# EAGLE design pid2_levitador (EAGLE 9.6.2)
Controladores PID analógicos con etapa de potencia (levitador magnético) - Brahiam Alberto Campiño Romero

## Sheet 1 of 2
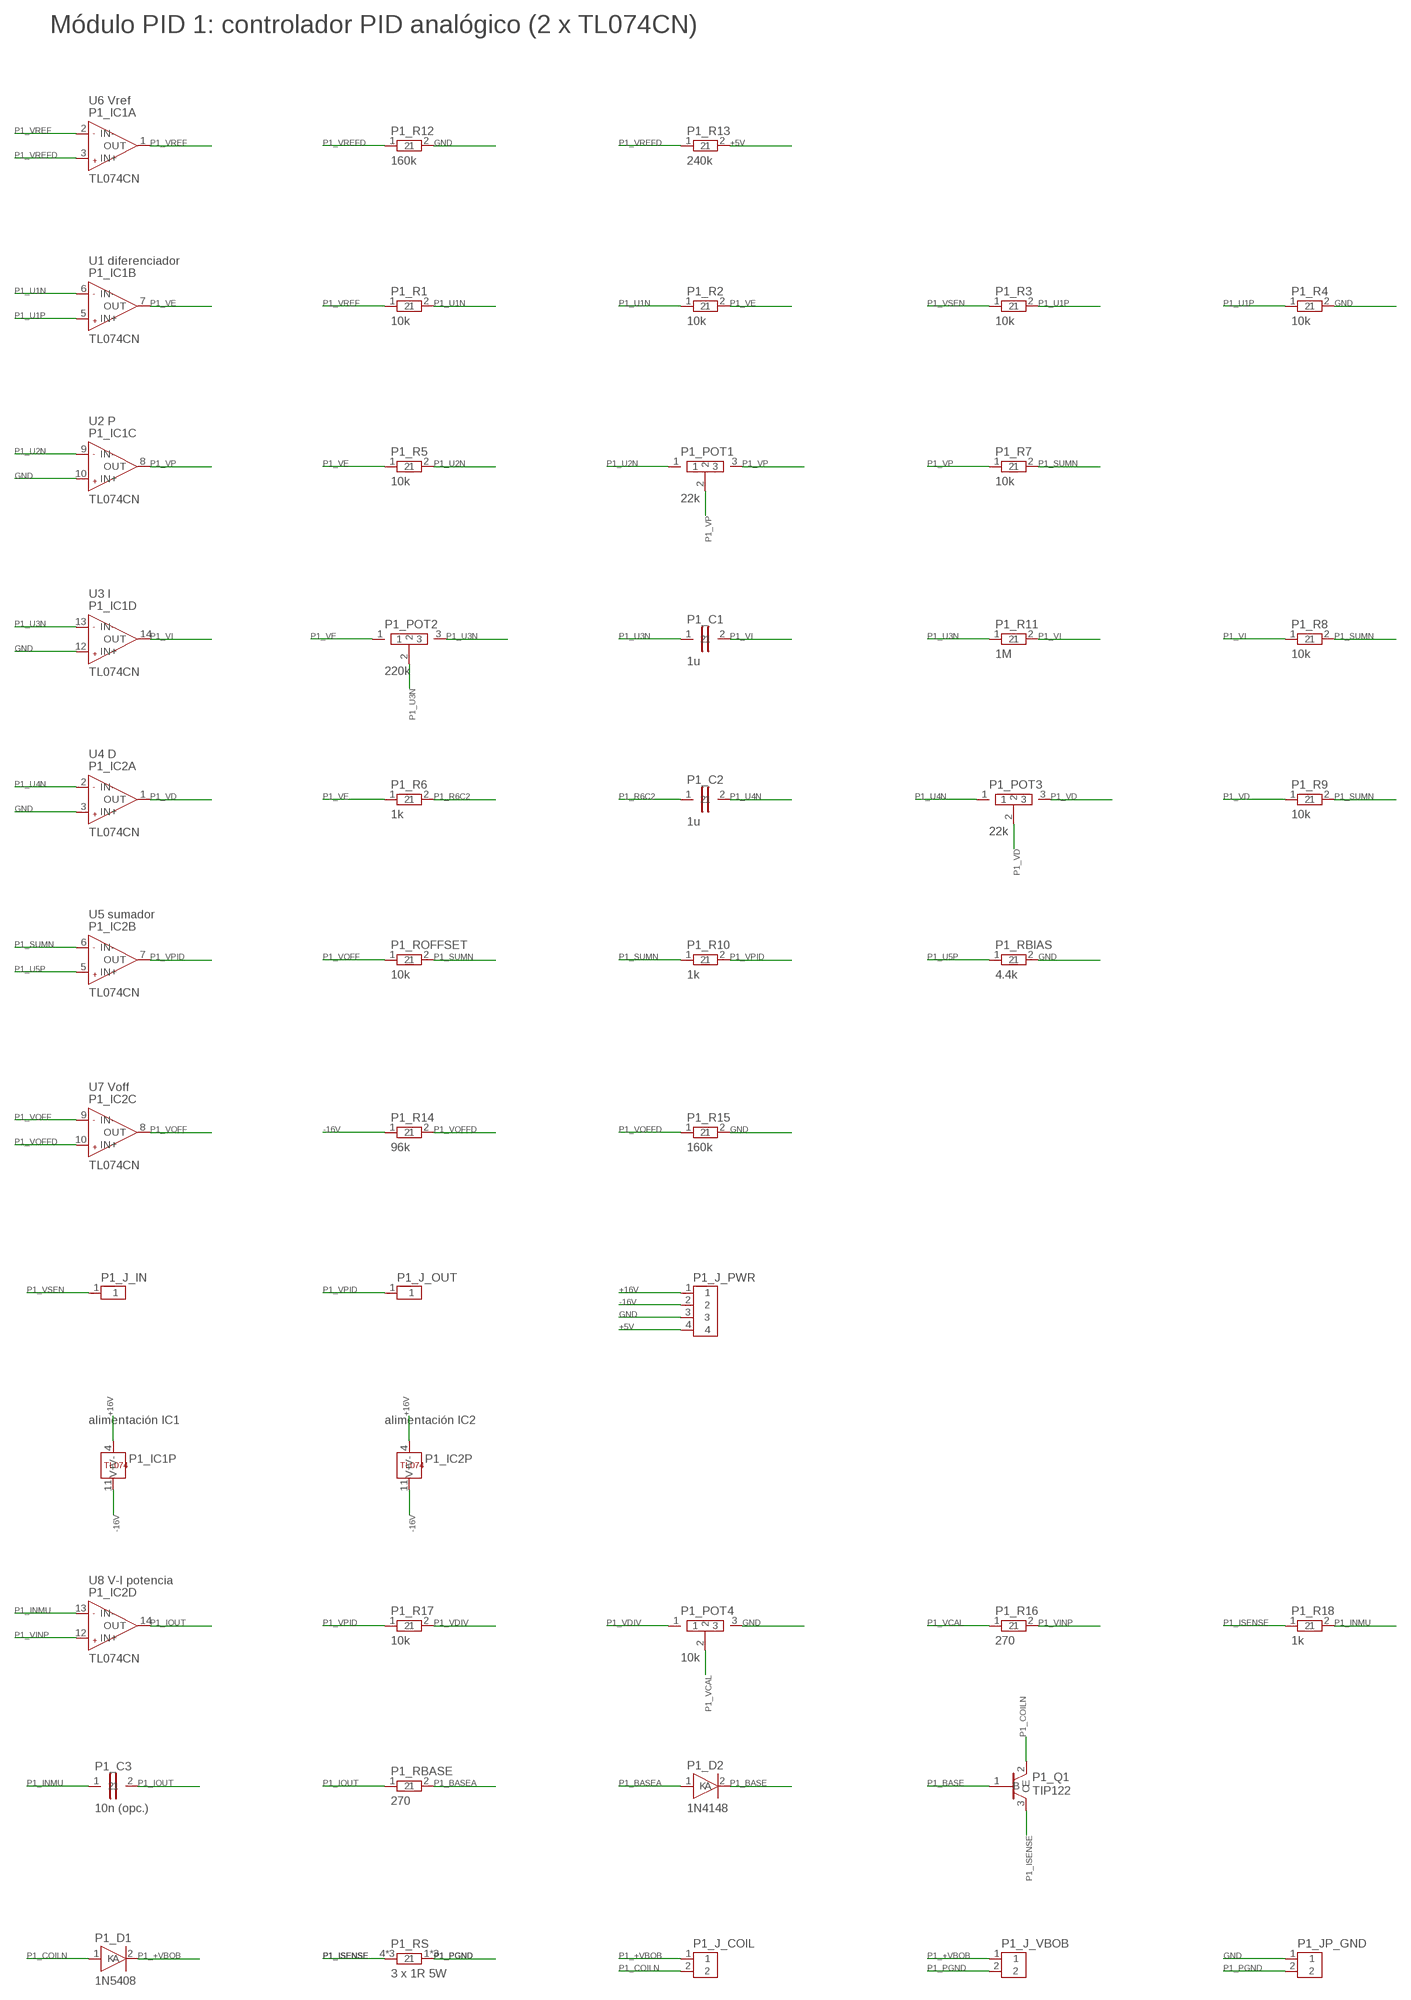
[diagram p0: schematic, sheet 1]

### Parts
P1_C1  1u  C  [CAP]
P1_C2  1u  C  [CAP]
P1_C3  10n (opc.)  C  [CAP]
P1_D1  1N5408  D1N5408  [DIODE]
P1_D2  1N4148  D1N4148  [DIODE_S]
P1_IC1  TL074CN  TL074  [DIL14]
P1_IC2  TL074CN  TL074  [DIL14]
P1_J_COIL  BOBINA  TERM2  [TERM2]
P1_J_IN  VSENSOR  HDR1  [HDR1]
P1_J_OUT  VPID  HDR1  [HDR1]
P1_J_PWR  PWR  HDR4  [HDR4]
P1_J_VBOB  VBOB  TERM2  [TERM2]
P1_JP_GND  GND-PGND  HDR2  [HDR2]
P1_POT1  22k  POT  [POT]
P1_POT2  220k  POT  [POT]
P1_POT3  22k  POT  [POT]
P1_POT4  10k  POT  [POT]
P1_Q1  TIP122  [TO220]
P1_R1  10k  R  [RES]
P1_R2  10k  R  [RES]
P1_R3  10k  R  [RES]
P1_R4  10k  R  [RES]
P1_R5  10k  R  [RES]
P1_R6  1k  R  [RES]
P1_R7  10k  R  [RES]
P1_R8  10k  R  [RES]
P1_R9  10k  R  [RES]
P1_R10  1k  R  [RES]
P1_R11  1M  R  [RES]
P1_R12  160k  R  [RES]
P1_R13  240k  R  [RES]
P1_R14  96k  R  [RES]
P1_R15  160k  R  [RES]
P1_R16  270  R  [RES]
P1_R17  10k  R  [RES]
P1_R18  1k  R  [RES]
P1_RBASE  270  R  [RES]
P1_RBIAS  4.4k  R  [RES]
P1_ROFFSET  10k  R  [RES]
P1_RS  3 x 1R 5W  RSB  [RSBANK]

### Nets
+5V: P1_J_PWR.4 P1_R13.2 ; also sheet 2
+16V: P1_IC1.4(P:V+) P1_IC2.4(P:V+) P1_J_PWR.1 ; also sheet 2
-16V: P1_IC1.11(P:V-) P1_IC2.11(P:V-) P1_J_PWR.2 P1_R14.1 ; also sheet 2
GND: P1_IC1.10(C:IN+) P1_IC1.12(D:IN+) P1_IC2.3(A:IN+) P1_J_PWR.3 P1_JP_GND.1 P1_POT4.3 P1_R4.2 P1_R12.2 P1_R15.2 P1_RBIAS.2 ; also sheet 2
P1_+VBOB: P1_D1.2(K) P1_J_COIL.1 P1_J_VBOB.1
P1_BASE: P1_D2.2(K) P1_Q1.1(B)
P1_BASEA: P1_D2.1(A) P1_RBASE.2
P1_COILN: P1_D1.1(A) P1_J_COIL.2 P1_Q1.2(C)
P1_INMU: P1_C3.1 P1_IC2.13(D:IN-) P1_R18.2
P1_IOUT: P1_C3.2 P1_IC2.14(D:OUT) P1_RBASE.1
P1_ISENSE: P1_Q1.3(E) P1_R18.1 P1_RS.4 P1_RS.5 P1_RS.6
P1_PGND: P1_J_VBOB.2 P1_JP_GND.2 P1_RS.1 P1_RS.2 P1_RS.3
P1_R6C2: P1_C2.1 P1_R6.2
P1_SUMN: P1_IC2.6(B:IN-) P1_R7.2 P1_R8.2 P1_R9.2 P1_R10.1 P1_ROFFSET.2
P1_U1N: P1_IC1.6(B:IN-) P1_R1.2 P1_R2.1
P1_U1P: P1_IC1.5(B:IN+) P1_R3.2 P1_R4.1
P1_U2N: P1_IC1.9(C:IN-) P1_POT1.1 P1_R5.2
P1_U3N: P1_C1.1 P1_IC1.13(D:IN-) P1_POT2.2 P1_POT2.3 P1_R11.1
P1_U4N: P1_C2.2 P1_IC2.2(A:IN-) P1_POT3.1
P1_U5P: P1_IC2.5(B:IN+) P1_RBIAS.1
P1_VCAL: P1_POT4.2 P1_R16.1
P1_VD: P1_IC2.1(A:OUT) P1_POT3.2 P1_POT3.3 P1_R9.1
P1_VDIV: P1_POT4.1 P1_R17.2
P1_VE: P1_IC1.7(B:OUT) P1_POT2.1 P1_R2.2 P1_R5.1 P1_R6.1
P1_VI: P1_C1.2 P1_IC1.14(D:OUT) P1_R8.1 P1_R11.2
P1_VINP: P1_IC2.12(D:IN+) P1_R16.2
P1_VOFF: P1_IC2.8(C:OUT) P1_IC2.9(C:IN-) P1_ROFFSET.1
P1_VOFFD: P1_IC2.10(C:IN+) P1_R14.2 P1_R15.1
P1_VP: P1_IC1.8(C:OUT) P1_POT1.2 P1_POT1.3 P1_R7.1
P1_VPID: P1_IC2.7(B:OUT) P1_J_OUT.1 P1_R10.2 P1_R17.1
P1_VREF: P1_IC1.1(A:OUT) P1_IC1.2(A:IN-) P1_R1.1
P1_VREFD: P1_IC1.3(A:IN+) P1_R12.1 P1_R13.1
P1_VSEN: P1_J_IN.1 P1_R3.1

### Notes on the sheet
- Módulo PID 1: controlador PID analógico (2 x TL074CN)
- U6 Vref
- U1 diferenciador
- U2 P
- U3 I
- U4 D
- U5 sumador
- U7 Voff
- alimentación IC1 | alimentación IC2
- U8 V-I potencia

## Sheet 2 of 2
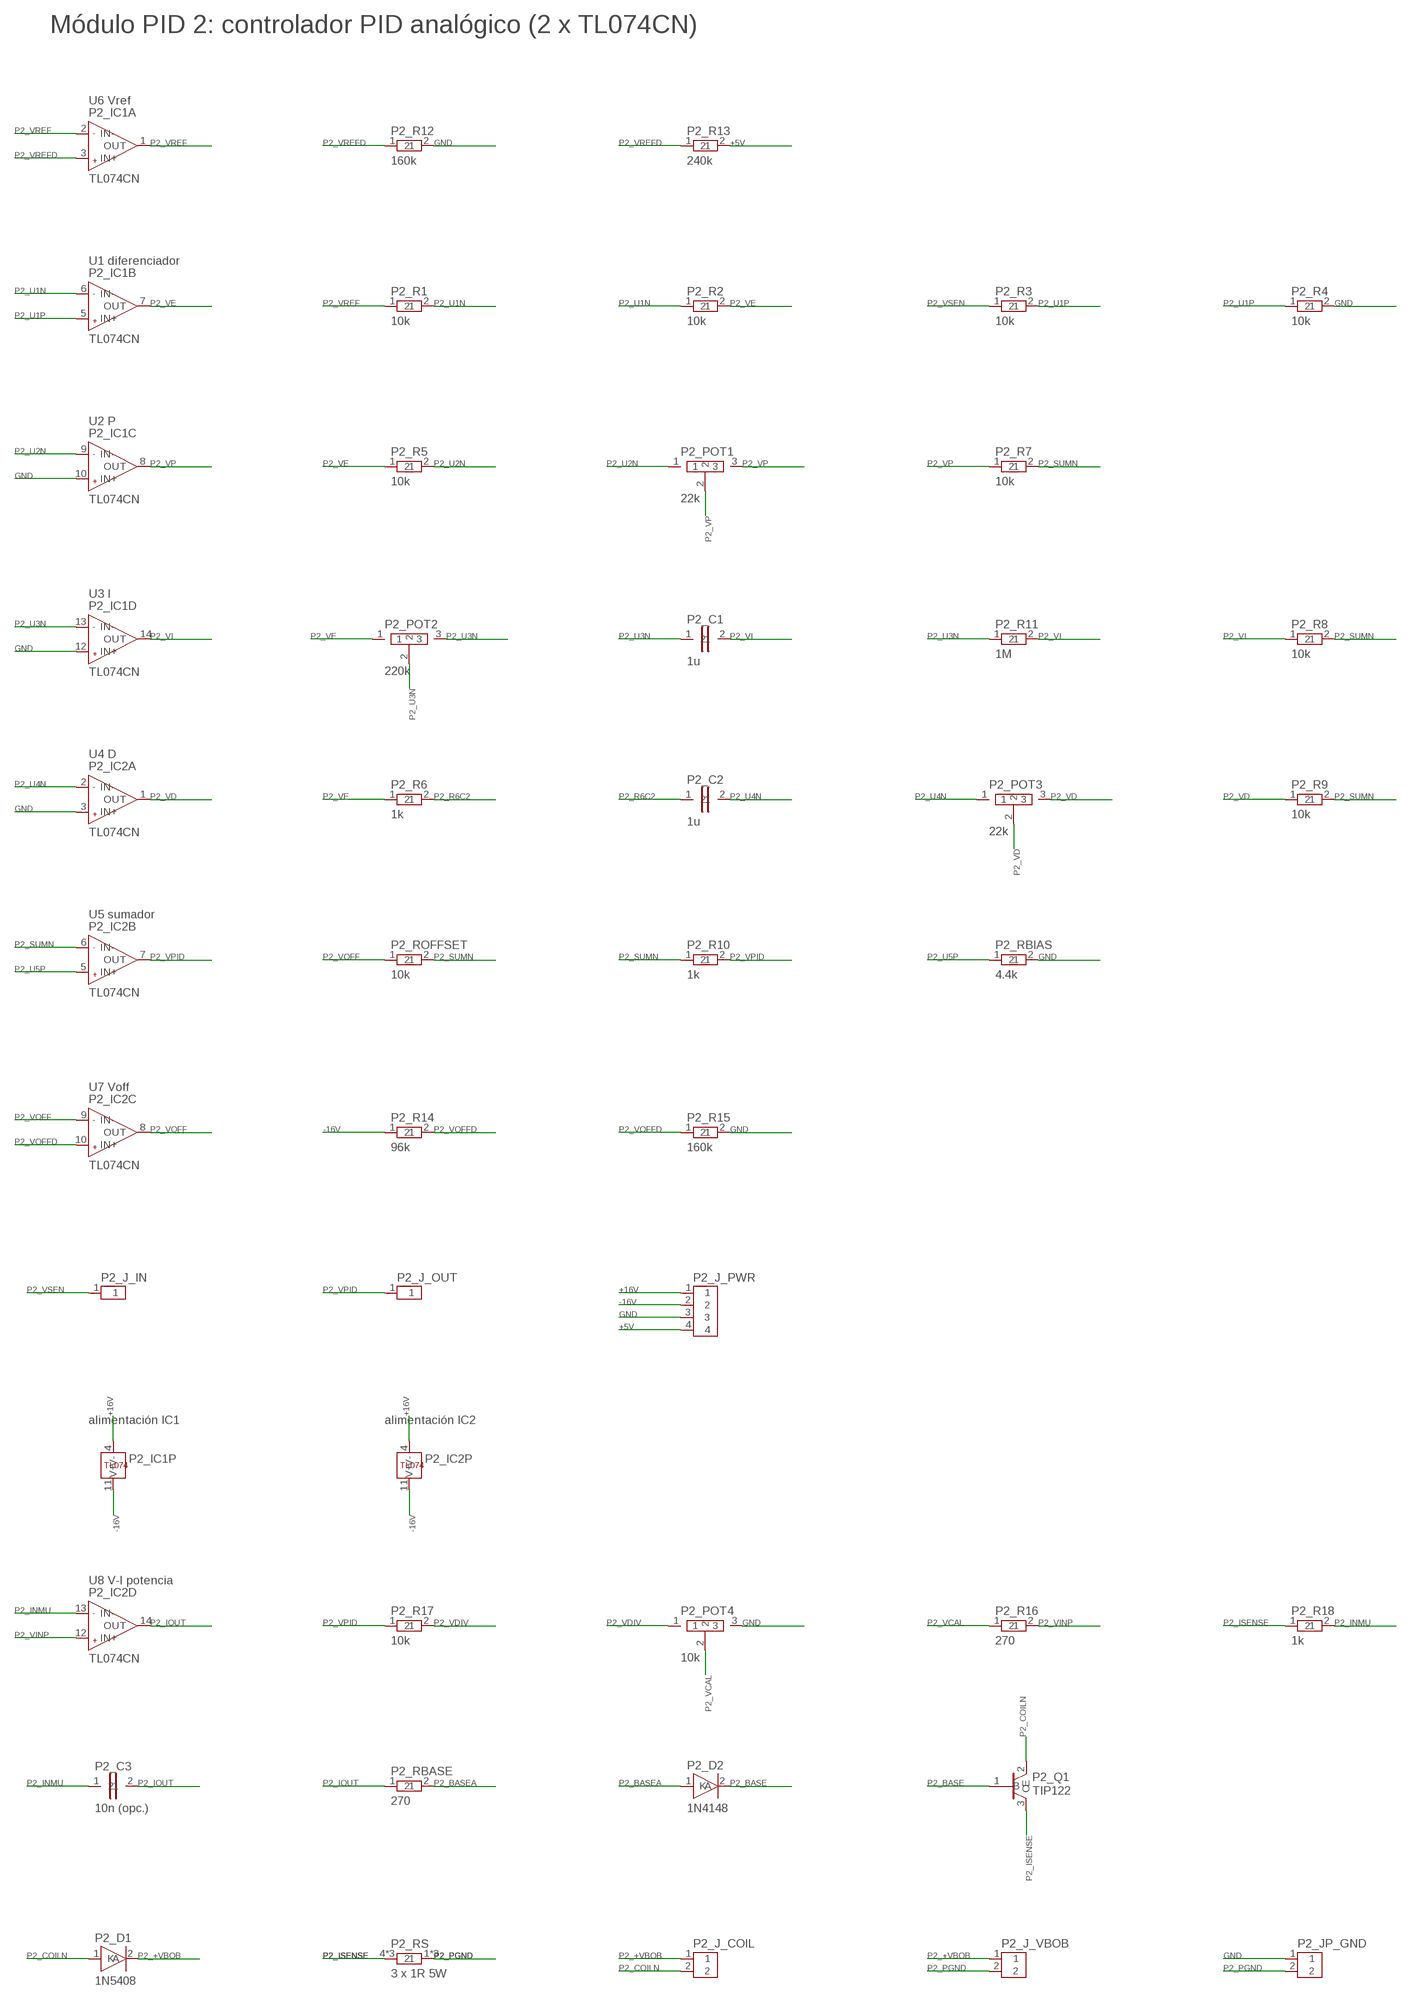
[diagram p1: schematic, sheet 2]

### Parts
P2_C1  1u  C  [CAP]
P2_C2  1u  C  [CAP]
P2_C3  10n (opc.)  C  [CAP]
P2_D1  1N5408  D1N5408  [DIODE]
P2_D2  1N4148  D1N4148  [DIODE_S]
P2_IC1  TL074CN  TL074  [DIL14]
P2_IC2  TL074CN  TL074  [DIL14]
P2_J_COIL  BOBINA  TERM2  [TERM2]
P2_J_IN  VSENSOR  HDR1  [HDR1]
P2_J_OUT  VPID  HDR1  [HDR1]
P2_J_PWR  PWR  HDR4  [HDR4]
P2_J_VBOB  VBOB  TERM2  [TERM2]
P2_JP_GND  GND-PGND  HDR2  [HDR2]
P2_POT1  22k  POT  [POT]
P2_POT2  220k  POT  [POT]
P2_POT3  22k  POT  [POT]
P2_POT4  10k  POT  [POT]
P2_Q1  TIP122  [TO220]
P2_R1  10k  R  [RES]
P2_R2  10k  R  [RES]
P2_R3  10k  R  [RES]
P2_R4  10k  R  [RES]
P2_R5  10k  R  [RES]
P2_R6  1k  R  [RES]
P2_R7  10k  R  [RES]
P2_R8  10k  R  [RES]
P2_R9  10k  R  [RES]
P2_R10  1k  R  [RES]
P2_R11  1M  R  [RES]
P2_R12  160k  R  [RES]
P2_R13  240k  R  [RES]
P2_R14  96k  R  [RES]
P2_R15  160k  R  [RES]
P2_R16  270  R  [RES]
P2_R17  10k  R  [RES]
P2_R18  1k  R  [RES]
P2_RBASE  270  R  [RES]
P2_RBIAS  4.4k  R  [RES]
P2_ROFFSET  10k  R  [RES]
P2_RS  3 x 1R 5W  RSB  [RSBANK]

### Nets
+5V: P2_J_PWR.4 P2_R13.2 ; also sheet 1
+16V: P2_IC1.4(P:V+) P2_IC2.4(P:V+) P2_J_PWR.1 ; also sheet 1
-16V: P2_IC1.11(P:V-) P2_IC2.11(P:V-) P2_J_PWR.2 P2_R14.1 ; also sheet 1
GND: P2_IC1.10(C:IN+) P2_IC1.12(D:IN+) P2_IC2.3(A:IN+) P2_J_PWR.3 P2_JP_GND.1 P2_POT4.3 P2_R4.2 P2_R12.2 P2_R15.2 P2_RBIAS.2 ; also sheet 1
P2_+VBOB: P2_D1.2(K) P2_J_COIL.1 P2_J_VBOB.1
P2_BASE: P2_D2.2(K) P2_Q1.1(B)
P2_BASEA: P2_D2.1(A) P2_RBASE.2
P2_COILN: P2_D1.1(A) P2_J_COIL.2 P2_Q1.2(C)
P2_INMU: P2_C3.1 P2_IC2.13(D:IN-) P2_R18.2
P2_IOUT: P2_C3.2 P2_IC2.14(D:OUT) P2_RBASE.1
P2_ISENSE: P2_Q1.3(E) P2_R18.1 P2_RS.4 P2_RS.5 P2_RS.6
P2_PGND: P2_J_VBOB.2 P2_JP_GND.2 P2_RS.1 P2_RS.2 P2_RS.3
P2_R6C2: P2_C2.1 P2_R6.2
P2_SUMN: P2_IC2.6(B:IN-) P2_R7.2 P2_R8.2 P2_R9.2 P2_R10.1 P2_ROFFSET.2
P2_U1N: P2_IC1.6(B:IN-) P2_R1.2 P2_R2.1
P2_U1P: P2_IC1.5(B:IN+) P2_R3.2 P2_R4.1
P2_U2N: P2_IC1.9(C:IN-) P2_POT1.1 P2_R5.2
P2_U3N: P2_C1.1 P2_IC1.13(D:IN-) P2_POT2.2 P2_POT2.3 P2_R11.1
P2_U4N: P2_C2.2 P2_IC2.2(A:IN-) P2_POT3.1
P2_U5P: P2_IC2.5(B:IN+) P2_RBIAS.1
P2_VCAL: P2_POT4.2 P2_R16.1
P2_VD: P2_IC2.1(A:OUT) P2_POT3.2 P2_POT3.3 P2_R9.1
P2_VDIV: P2_POT4.1 P2_R17.2
P2_VE: P2_IC1.7(B:OUT) P2_POT2.1 P2_R2.2 P2_R5.1 P2_R6.1
P2_VI: P2_C1.2 P2_IC1.14(D:OUT) P2_R8.1 P2_R11.2
P2_VINP: P2_IC2.12(D:IN+) P2_R16.2
P2_VOFF: P2_IC2.8(C:OUT) P2_IC2.9(C:IN-) P2_ROFFSET.1
P2_VOFFD: P2_IC2.10(C:IN+) P2_R14.2 P2_R15.1
P2_VP: P2_IC1.8(C:OUT) P2_POT1.2 P2_POT1.3 P2_R7.1
P2_VPID: P2_IC2.7(B:OUT) P2_J_OUT.1 P2_R10.2 P2_R17.1
P2_VREF: P2_IC1.1(A:OUT) P2_IC1.2(A:IN-) P2_R1.1
P2_VREFD: P2_IC1.3(A:IN+) P2_R12.1 P2_R13.1
P2_VSEN: P2_J_IN.1 P2_R3.1

### Notes on the sheet
- Módulo PID 2: controlador PID analógico (2 x TL074CN)
- U6 Vref
- U1 diferenciador
- U2 P
- U3 I
- U4 D
- U5 sumador
- U7 Voff
- alimentación IC1 | alimentación IC2
- U8 V-I potencia

## Library data of the parts
P1_C1-P1_C3 P2_C1-P2_C3 = pid4:C
P1_D1 P2_D1 = pid4:D1N5408
P1_D2 P2_D2 = pid4:D1N4148
P1_IC1 P1_IC2 P2_IC1 P2_IC2 = pid4:TL074
P1_J_COIL P1_J_VBOB P2_J_COIL P2_J_VBOB = pid4:TERM2
P1_J_IN P1_J_OUT P2_J_IN P2_J_OUT = pid4:HDR1
P1_J_PWR P2_J_PWR = pid4:HDR4
P1_JP_GND P2_JP_GND = pid4:HDR2
P1_POT1-P1_POT4 P2_POT1-P2_POT4 = pid4:POT
P1_Q1 P2_Q1 = pid4:TIP122
P1_R1-P1_R18 P1_RBASE P1_RBIAS P1_ROFFSET P2_R1-P2_R18 P2_RBASE P2_RBIAS P2_ROFFSET = pid4:R
P1_RS P2_RS = pid4:RSB

## Board
Placa de controladores PID analógicos con etapa de potencia, una cara (cobre inferior) con puentes de alambre
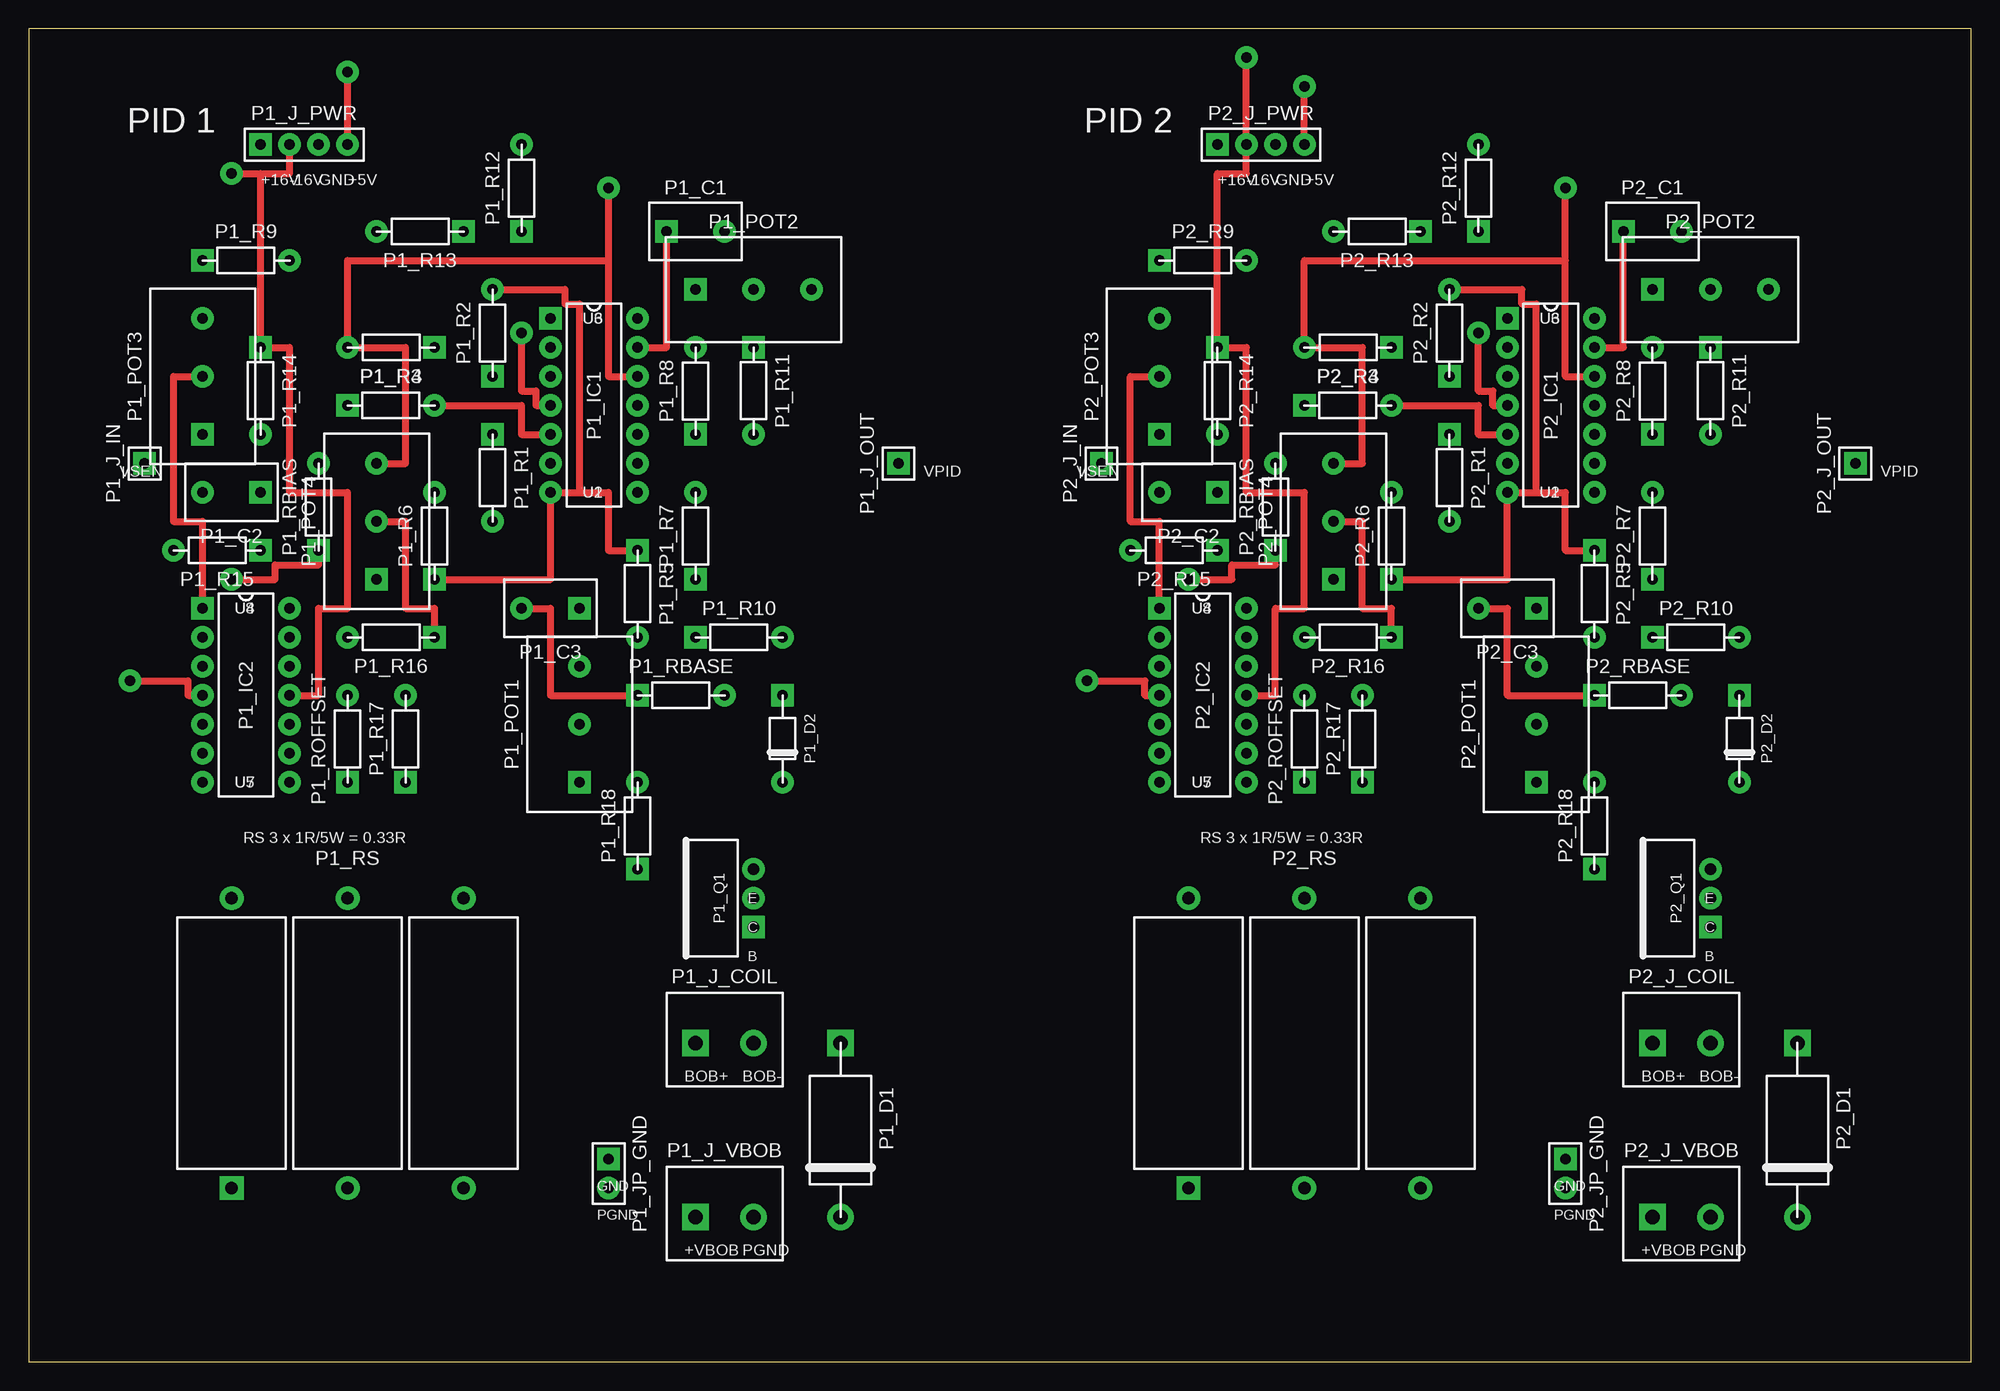
[diagram p2: board, top side]
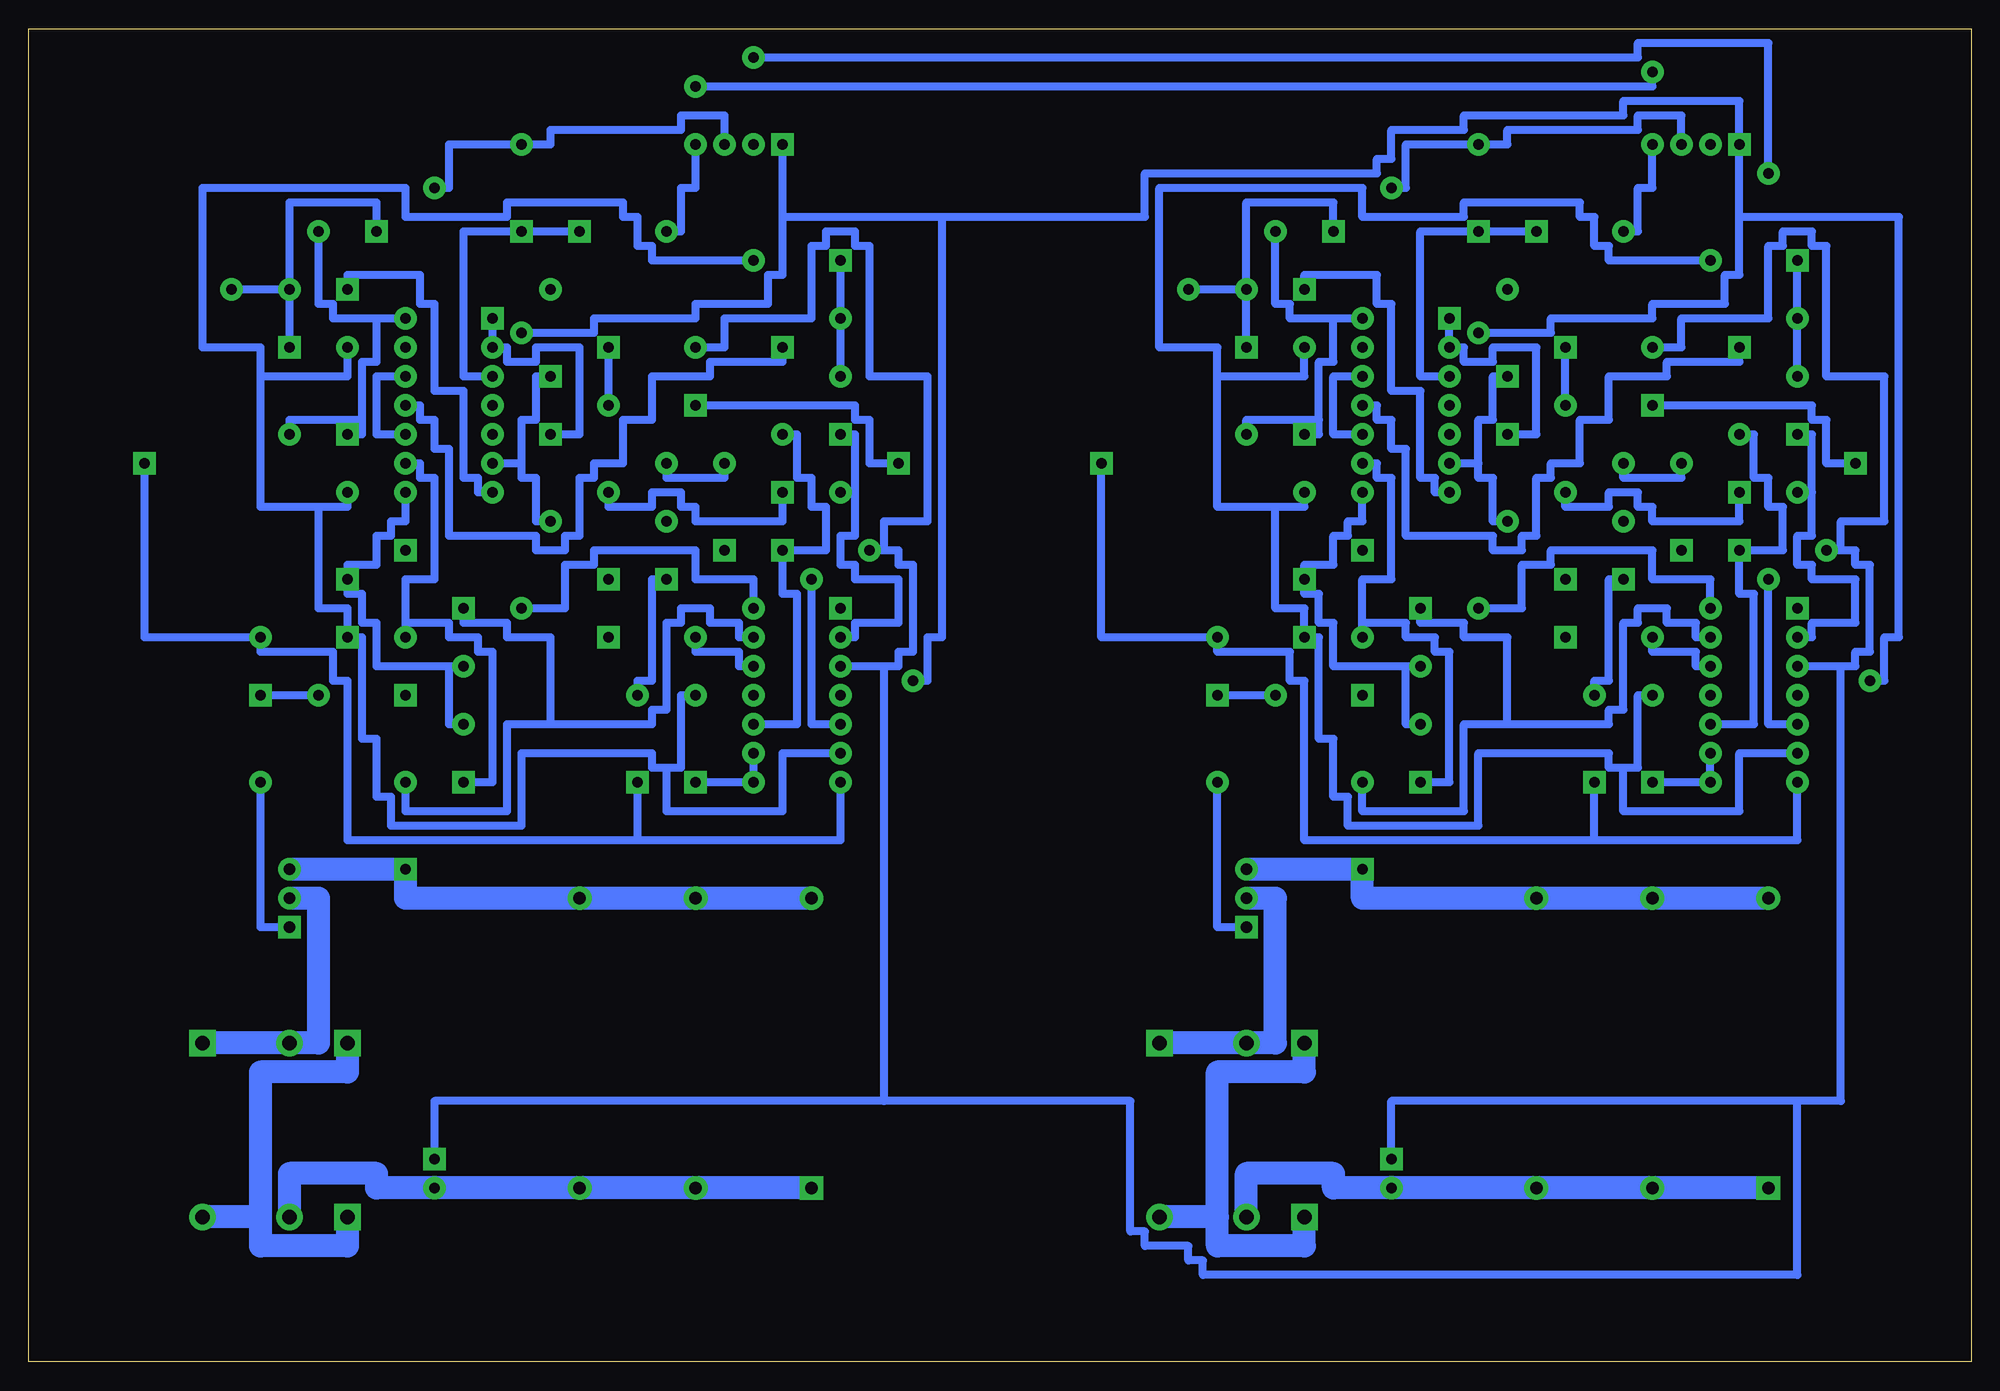
[diagram p3: board, bottom side, seen from below]

Size 170.18 x 116.84 mm. Coordinates in mm from the lower left corner, seen from the top.
Outline: 0,0 170.18,0 170.18,116.84 0,116.84 0,0
Copper layers (1*16): Top 0.035mm / dielectric 1.5mm / Bottom
Design rules "default": minimum track width 0.7mm, minimum drill 0.9mm, track to track 0.4mm, track to pad 0.4mm, pad to pad 0.4mm, via to via 0.4mm, copper to edge 0.6mm, drill to drill 0.4mm, minimum pad ring 0.5mm, minimum via ring 0.5mm

### Footprints (pad centres in the part's own frame; a part is rotated, then mirrored left to right if it is on the bottom)
CAP = drill 0.9 pad 2 square: 1 0,0 | drill 0.9 pad 2 round: 2 5.08,0
DIODE = drill 1.3 pad 2 square: 1 0,0 | drill 1.3 pad 2 round: 2 15.24,0
DIODE_S = drill 0.9 pad 2 square: 1 0,0 | drill 0.9 pad 2 round: 2 7.62,0
DIL14 = drill 0.9 pad 2 square: 1 0,0 | drill 0.9 pad 2 round: 2 0,-2.54; 3 0,-5.08; 4 0,-7.62; 5 0,-10.16; 6 0,-12.7; 7 0,-15.24; 8 7.62,-15.24; 9 7.62,-12.7; 10 7.62,-10.16; 11 7.62,-7.62; 12 7.62,-5.08; 13 7.62,-2.54; 14 7.62,0
TERM2 = drill 1.3 pad 2 square: 1 0,0 | drill 1.3 pad 2 round: 2 5.08,0
HDR1 = drill 0.9 pad 2 square: 1 0,0
HDR4 = drill 0.9 pad 2 square: 1 0,0 | drill 0.9 pad 2 round: 2 2.54,0; 3 5.08,0; 4 7.62,0
HDR2 = drill 0.9 pad 2 square: 1 0,0 | drill 0.9 pad 2 round: 2 2.54,0
POT = drill 0.9 pad 2 square: 1 0,0 | drill 0.9 pad 2 round: 2 5.08,0; 3 10.16,0
TO220 = drill 1 pad 2 square: 1 0,0 | drill 1 pad 2 round: 2 2.54,0; 3 5.08,0
RES = drill 0.9 pad 2 square: 1 0,0 | drill 0.9 pad 2 round: 2 7.62,0
RSBANK = drill 1.1 pad 2 square: 1 0,0 | drill 1.1 pad 2 round: 2 10.16,0; 3 20.32,0; 4 0,25.4; 5 10.16,25.4; 6 20.32,25.4

### Placement (x,y rotation side)
P1_C1  55.88,99.06 0 top
P1_C2  20.32,76.2 180 top
P1_C3  48.26,66.04 180 top
P1_D1  71.12,27.94 270 top
P1_D2  66.04,58.42 270 top
P1_IC1  45.72,91.44 0 top
P1_IC2  15.24,66.04 0 top
P1_J_COIL  58.42,27.94 0 top
P1_J_IN  10.16,78.74 90 top
P1_J_OUT  76.2,78.74 90 top
P1_J_PWR  20.32,106.68 0 top
P1_J_VBOB  58.42,12.7 0 top
P1_JP_GND  50.8,17.78 270 top
P1_POT1  48.26,50.8 90 top
P1_POT2  58.42,93.98 0 top
P1_POT3  15.24,81.28 90 top
P1_POT4  30.48,68.58 90 top
P1_Q1  63.5,38.1 90 top
P1_R1  40.64,81.28 270 top
P1_R2  40.64,86.36 90 top
P1_R3  27.94,83.82 0 top
P1_R4  35.56,88.9 180 top
P1_R5  53.34,71.12 270 top
P1_R6  35.56,68.58 90 top
P1_R7  58.42,68.58 90 top
P1_R8  58.42,81.28 90 top
P1_R9  15.24,96.52 0 top
P1_R10  58.42,63.5 0 top
P1_R11  63.5,88.9 270 top
P1_R12  43.18,99.06 90 top
P1_R13  38.1,99.06 180 top
P1_R14  20.32,88.9 270 top
P1_R15  20.32,71.12 180 top
P1_R16  35.56,63.5 180 top
P1_R17  33.02,50.8 90 top
P1_R18  53.34,43.18 90 top
P1_RBASE  53.34,58.42 0 top
P1_RBIAS  25.4,71.12 90 top
P1_ROFFSET  27.94,50.8 90 top
P1_RS  17.78,15.24 0 top
P2_C1  139.7,99.06 0 top
P2_C2  104.14,76.2 180 top
P2_C3  132.08,66.04 180 top
P2_D1  154.94,27.94 270 top
P2_D2  149.86,58.42 270 top
P2_IC1  129.54,91.44 0 top
P2_IC2  99.06,66.04 0 top
P2_J_COIL  142.24,27.94 0 top
P2_J_IN  93.98,78.74 90 top
P2_J_OUT  160.02,78.74 90 top
P2_J_PWR  104.14,106.68 0 top
P2_J_VBOB  142.24,12.7 0 top
P2_JP_GND  134.62,17.78 270 top
P2_POT1  132.08,50.8 90 top
P2_POT2  142.24,93.98 0 top
P2_POT3  99.06,81.28 90 top
P2_POT4  114.3,68.58 90 top
P2_Q1  147.32,38.1 90 top
P2_R1  124.46,81.28 270 top
P2_R2  124.46,86.36 90 top
P2_R3  111.76,83.82 0 top
P2_R4  119.38,88.9 180 top
P2_R5  137.16,71.12 270 top
P2_R6  119.38,68.58 90 top
P2_R7  142.24,68.58 90 top
P2_R8  142.24,81.28 90 top
P2_R9  99.06,96.52 0 top
P2_R10  142.24,63.5 0 top
P2_R11  147.32,88.9 270 top
P2_R12  127,99.06 90 top
P2_R13  121.92,99.06 180 top
P2_R14  104.14,88.9 270 top
P2_R15  104.14,71.12 180 top
P2_R16  119.38,63.5 180 top
P2_R17  116.84,50.8 90 top
P2_R18  137.16,43.18 90 top
P2_RBASE  137.16,58.42 0 top
P2_RBIAS  109.22,71.12 90 top
P2_ROFFSET  111.76,50.8 90 top
P2_RS  101.6,15.24 0 top

### Tracks (layer width: path | path; a pad name or v marks a point on that pad's centre or on a via)
+5V  (via drill 0.9 pad 2)
  Top 0.6: P1_J_PWR.4 v27.94,113.03 | P2_J_PWR.4 v111.76,111.76
  Bottom 0.7: P1_R13.2 29.21,99.06 29.21,102.87 27.94,102.87 P1_J_PWR.4 | P2_R13.2 113.03,99.06 113.03,102.87 111.76,102.87 P2_J_PWR.4 | v111.76,111.76 27.94,111.76 v27.94,113.03
+16V  (via drill 0.9 pad 2)
  Top 0.6: P1_IC2.4 13.97,58.42 13.97,59.69 v8.89,59.69 | P2_IC2.4 97.79,58.42 97.79,59.69 v92.71,59.69 | P1_IC1.4 44.45,83.82 44.45,85.09 43.18,85.09 v43.18,90.17 | P2_IC1.4 128.27,83.82 128.27,85.09 127,85.09 v127,90.17
  Bottom 0.7: v8.89,59.69 7.62,59.69 7.62,63.5 6.35,63.5 6.35,100.33 20.32,100.33 | v92.71,59.69 91.44,59.69 91.44,63.5 90.17,63.5 90.17,100.33 | v43.18,90.17 36.83,90.17 36.83,91.44 27.94,91.44 27.94,92.71 21.59,92.71 21.59,95.25 20.32,95.25 20.32,110.49 30.48,110.49 30.48,109.22 44.45,109.22 44.45,107.95 50.8,107.95 50.8,105.41 52.07,105.41 52.07,104.14 72.39,104.14 72.39,100.33 104.14,100.33 | v127,90.17 120.65,90.17 120.65,91.44 111.76,91.44 111.76,92.71 105.41,92.71 105.41,95.25 104.14,95.25 P2_J_PWR.1
-16V  (via drill 0.9 pad 2)
  Top 0.6: P1_IC2.11 25.4,58.42 25.4,66.04 27.94,66.04 27.94,76.2 22.86,76.2 22.86,88.9 P1_R14.1 20.32,104.14 | P2_IC2.11 109.22,58.42 109.22,66.04 111.76,66.04 111.76,76.2 106.68,76.2 106.68,88.9 P2_R14.1 104.14,104.14 106.68,104.14 v106.68,114.3 | v17.78,104.14 22.86,104.14 P1_J_PWR.2
  Bottom 0.7: P1_IC1.11 52.07,83.82 52.07,82.55 50.8,82.55 50.8,80.01 49.53,80.01 49.53,72.39 41.91,72.39 41.91,71.12 39.37,71.12 39.37,72.39 38.1,72.39 38.1,77.47 36.83,77.47 36.83,78.74 34.29,78.74 34.29,82.55 31.75,82.55 31.75,86.36 26.67,86.36 26.67,87.63 20.32,87.63 P1_R14.1 | P2_IC1.11 135.89,83.82 135.89,82.55 134.62,82.55 134.62,80.01 133.35,80.01 133.35,72.39 125.73,72.39 125.73,71.12 123.19,71.12 123.19,72.39 121.92,72.39 121.92,77.47 120.65,77.47 120.65,78.74 118.11,78.74 118.11,82.55 115.57,82.55 115.57,86.36 110.49,86.36 110.49,87.63 104.14,87.63 P2_R14.1 | v106.68,114.3 29.21,114.3 29.21,115.57 17.78,115.57 v17.78,104.14
GND  (via drill 0.9 pad 2)
  Top 0.6: P1_POT4.3 33.02,78.74 33.02,88.9 P1_R4.2 27.94,96.52 50.8,96.52 | P2_POT4.3 116.84,78.74 116.84,88.9 P2_R4.2 111.76,96.52 134.62,96.52 | P1_IC1.12 50.8,86.36 v50.8,102.87 | P2_IC1.12 134.62,86.36 v134.62,102.87
  Bottom 0.7: P1_IC2.3 10.16,60.96 10.16,62.23 8.89,62.23 8.89,69.85 10.16,69.85 10.16,71.12 P1_R15.2 | P2_IC2.3 93.98,60.96 93.98,62.23 92.71,62.23 92.71,69.85 93.98,69.85 93.98,71.12 P2_R15.2 | P1_IC1.10 55.88,81.28 55.88,86.36 P1_IC1.12 | P2_IC1.10 139.7,81.28 139.7,86.36 P2_IC1.12 | P1_R4.2 25.4,88.9 25.4,91.44 17.78,91.44 17.78,97.79 16.51,97.79 16.51,99.06 13.97,99.06 13.97,97.79 12.7,97.79 12.7,86.36 7.62,86.36 7.62,73.66 11.43,73.66 11.43,71.12 | P2_R4.2 109.22,88.9 109.22,91.44 101.6,91.44 101.6,97.79 100.33,97.79 100.33,99.06 97.79,99.06 97.79,97.79 96.52,97.79 96.52,86.36 91.44,86.36 91.44,73.66 95.25,73.66 95.25,71.12 | v50.8,102.87 49.53,102.87 49.53,106.68 40.64,106.68 40.64,107.95 29.21,107.95 29.21,109.22 25.4,109.22 P1_J_PWR.3 | v134.62,102.87 133.35,102.87 133.35,106.68 124.46,106.68 124.46,107.95 113.03,107.95 113.03,109.22 109.22,109.22 P2_J_PWR.3 | 11.43,60.96 11.43,22.86 50.8,22.86 P1_JP_GND.1 | 15.24,22.86 15.24,7.62 67.31,7.62 67.31,8.89 68.58,8.89 68.58,10.16 72.39,10.16 72.39,11.43 73.66,11.43 73.66,22.86 134.62,22.86 P2_JP_GND.1 | P1_RBIAS.2 25.4,77.47 30.48,77.47 P1_POT4.3 | 95.25,22.86 95.25,60.96 | P2_RBIAS.2 109.22,77.47 114.3,77.47 P2_POT4.3
P1_+VBOB
  Bottom 2: 66.04,12.7 P1_D1.2 | P1_J_VBOB.1 58.42,10.16 66.04,10.16 66.04,25.4 58.42,25.4 P1_J_COIL.1
P1_BASE
  Bottom 0.7: P1_Q1.1 66.04,38.1 P1_D2.2
P1_BASEA
  Bottom 0.7: P1_RBASE.2 P1_D2.1
P1_COILN
  Bottom 2: P1_D1.1 60.96,27.94 60.96,40.64 P1_Q1.2
P1_INMU
  Bottom 0.7: P1_IC2.13 24.13,63.5 24.13,64.77 26.67,64.77 26.67,66.04 29.21,66.04 29.21,64.77 30.48,64.77 30.48,57.15 31.75,57.15 31.75,55.88 44.45,55.88 44.45,48.26 53.34,48.26 P1_R18.2 | 40.64,55.88 40.64,63.5 44.45,63.5 44.45,64.77 48.26,64.77 P1_C3.1
P1_IOUT
  Top 0.6: P1_RBASE.1 45.72,58.42 45.72,66.04 P1_C3.2
  Bottom 0.7: P1_C3.2 39.37,66.04 39.37,69.85 36.83,69.85 36.83,71.12 27.94,71.12 27.94,68.58 22.86,68.58 P1_IC2.14
P1_ISENSE
  Bottom 2: P1_RS.4 53.34,40.64 P1_R18.1 P1_Q1.3
P1_PGND
  Bottom 2: P1_RS.1 55.88,15.24 55.88,16.51 63.5,16.51 P1_J_VBOB.2
P1_R6C2
  Bottom 0.7: P1_C2.1 20.32,73.66 27.94,73.66 27.94,74.93 29.21,74.93 29.21,76.2 31.75,76.2 31.75,74.93 35.56,74.93 P1_R6.2
P1_SUMN
  Bottom 0.7: P1_IC2.6 20.32,53.34 20.32,48.26 30.48,48.26 30.48,52.07 | P1_ROFFSET.2 29.21,58.42 29.21,52.07 31.75,52.07 31.75,53.34 43.18,53.34 43.18,46.99 54.61,46.99 54.61,49.53 55.88,49.53 55.88,54.61 57.15,54.61 57.15,63.5 P1_R10.1 58.42,66.04 60.96,66.04 60.96,74.93 | 66.04,86.36 58.42,86.36 P1_R8.2 | P1_R9.2 31.75,96.52 31.75,97.79 33.02,97.79 33.02,100.33 34.29,100.33 34.29,101.6 44.45,101.6 44.45,100.33 53.34,100.33 53.34,102.87 71.12,102.87 71.12,88.9 66.04,88.9 66.04,74.93 58.42,74.93 P1_R7.2
P1_U1N
  Bottom 0.7: P1_R1.2 41.91,73.66 41.91,77.47 43.18,77.47 43.18,82.55 41.91,82.55 41.91,86.36 P1_R2.1 | 43.18,78.74 P1_IC1.6
P1_U1P
  Top 0.6: P1_IC1.5 43.18,81.28 43.18,83.82 P1_R3.2
  Bottom 0.7: P1_R3.2 P1_R4.1
P1_U2N
  Bottom 0.7: P1_POT1.1 45.72,50.8 45.72,62.23 46.99,62.23 46.99,63.5 49.53,63.5 49.53,64.77 53.34,64.77 | P1_IC1.9 52.07,78.74 52.07,77.47 50.8,77.47 50.8,68.58 53.34,68.58 P1_R5.2
P1_U3N
  Top 0.6: P1_IC1.13 55.88,88.9 P1_C1.1
  Bottom 0.7: P1_POT2.2 P1_POT2.3 | P1_C1.1 55.88,101.6 63.5,101.6 P1_R11.1
P1_U4N
  Bottom 0.7: P1_IC2.2 13.97,63.5 13.97,64.77 10.16,64.77 10.16,68.58 13.97,68.58 13.97,69.85 15.24,69.85 15.24,72.39 13.97,72.39 13.97,81.28 P1_POT3.1 | 13.97,76.2 P1_C2.2
P1_U5P  (via drill 0.9 pad 2)
  Top 0.6: v17.78,68.58 21.59,68.58 21.59,69.85 25.4,69.85 P1_RBIAS.1
  Bottom 0.7: P1_IC2.5 17.78,55.88 v17.78,68.58
P1_VCAL
  Top 0.6: P1_POT4.2 33.02,73.66 33.02,66.04 35.56,66.04 P1_R16.1
P1_VD
  Top 0.6: P1_POT3.2 12.7,86.36 12.7,73.66 15.24,73.66 P1_IC2.1
  Bottom 0.7: P1_POT3.2 P1_R9.1
P1_VDIV
  Bottom 0.7: P1_POT4.1 31.75,68.58 31.75,59.69 33.02,59.69 P1_R17.2
P1_VE
  Top 0.6: P1_R6.1 45.72,68.58 P1_IC1.7 50.8,76.2 50.8,71.12 P1_R5.1 | P1_R2.2 46.99,93.98 46.99,92.71 48.26,92.71 48.26,76.2
  Bottom 0.7: P1_IC1.7 46.99,76.2 46.99,77.47 48.26,77.47 48.26,85.09 50.8,85.09 50.8,92.71 52.07,92.71 52.07,95.25 58.42,95.25 P1_POT2.1
P1_VI
  Bottom 0.7: P1_R8.1 57.15,81.28 57.15,87.63 55.88,87.63 55.88,91.44 | 57.15,82.55 63.5,82.55 P1_R11.2 | P1_IC1.14 59.69,91.44 59.69,92.71 60.96,92.71 P1_C1.2
P1_VINP
  Bottom 0.7: P1_IC2.12 24.13,60.96 24.13,62.23 27.94,62.23 P1_R16.2
P1_VOFF
  Bottom 0.7: P1_ROFFSET.1 P1_IC2.8 P1_IC2.9
P1_VOFFD
  Bottom 0.7: P1_IC2.10 19.05,55.88 19.05,67.31 20.32,67.31 P1_R15.1 16.51,71.12 16.51,74.93 17.78,74.93 17.78,77.47 19.05,77.47 19.05,81.28 P1_R14.2
P1_VP
  Bottom 0.7: P1_POT1.2 49.53,55.88 49.53,60.96 | P1_POT1.3 55.88,60.96 55.88,64.77 57.15,64.77 57.15,67.31 58.42,67.31 58.42,69.85 55.88,69.85 55.88,72.39 54.61,72.39 54.61,73.66 53.34,73.66 P1_IC1.8
P1_VPID
  Bottom 0.7: P1_IC2.7 15.24,45.72 58.42,45.72 58.42,59.69 59.69,59.69 59.69,62.23 66.04,62.23 P1_R10.2 76.2,63.5 P1_J_OUT.1 | 33.02,45.72 P1_R17.1
P1_VREF
  Bottom 0.7: P1_R1.1 38.1,81.28 38.1,88.9 41.91,88.9 41.91,87.63 44.45,87.63 44.45,88.9 P1_IC1.2 P1_IC1.1
P1_VREFD
  Bottom 0.7: P1_IC1.3 48.26,86.36 48.26,99.06 P1_R13.1
P1_VSEN
  Bottom 0.7: P1_J_IN.1 12.7,78.74 12.7,82.55 13.97,82.55 13.97,83.82 P1_R3.1
P2_+VBOB
  Bottom 2: 149.86,12.7 P2_D1.2 | P2_J_VBOB.1 142.24,10.16 149.86,10.16 149.86,25.4 142.24,25.4 P2_J_COIL.1
P2_BASE
  Bottom 0.7: P2_Q1.1 149.86,38.1 P2_D2.2
P2_BASEA
  Bottom 0.7: P2_RBASE.2 P2_D2.1
P2_COILN
  Bottom 2: P2_D1.1 144.78,27.94 144.78,40.64 P2_Q1.2
P2_INMU
  Bottom 0.7: P2_IC2.13 107.95,63.5 107.95,64.77 110.49,64.77 110.49,66.04 113.03,66.04 113.03,64.77 114.3,64.77 114.3,57.15 115.57,57.15 115.57,55.88 128.27,55.88 128.27,48.26 137.16,48.26 P2_R18.2 | 124.46,55.88 124.46,63.5 128.27,63.5 128.27,64.77 132.08,64.77 P2_C3.1
P2_IOUT
  Top 0.6: P2_RBASE.1 129.54,58.42 129.54,66.04 P2_C3.2
  Bottom 0.7: P2_C3.2 123.19,66.04 123.19,69.85 120.65,69.85 120.65,71.12 111.76,71.12 111.76,68.58 106.68,68.58 P2_IC2.14
P2_ISENSE
  Bottom 2: P2_RS.4 137.16,40.64 P2_R18.1 P2_Q1.3
P2_PGND
  Bottom 2: P2_RS.1 139.7,15.24 139.7,16.51 147.32,16.51 P2_J_VBOB.2
P2_R6C2
  Bottom 0.7: P2_C2.1 104.14,73.66 111.76,73.66 111.76,74.93 113.03,74.93 113.03,76.2 115.57,76.2 115.57,74.93 119.38,74.93 P2_R6.2
P2_SUMN
  Bottom 0.7: P2_IC2.6 104.14,53.34 104.14,48.26 114.3,48.26 114.3,52.07 | P2_ROFFSET.2 113.03,58.42 113.03,52.07 115.57,52.07 115.57,53.34 127,53.34 127,46.99 138.43,46.99 138.43,49.53 139.7,49.53 139.7,54.61 140.97,54.61 140.97,63.5 P2_R10.1 142.24,66.04 144.78,66.04 144.78,74.93 | 149.86,86.36 142.24,86.36 P2_R8.2 | P2_R9.2 115.57,96.52 115.57,97.79 116.84,97.79 116.84,100.33 118.11,100.33 118.11,101.6 128.27,101.6 128.27,100.33 137.16,100.33 137.16,102.87 154.94,102.87 154.94,88.9 149.86,88.9 149.86,74.93 142.24,74.93 P2_R7.2
P2_U1N
  Bottom 0.7: P2_R1.2 125.73,73.66 125.73,77.47 127,77.47 127,82.55 125.73,82.55 125.73,86.36 P2_R2.1 | 127,78.74 P2_IC1.6
P2_U1P
  Top 0.6: P2_IC1.5 127,81.28 127,83.82 P2_R3.2
  Bottom 0.7: P2_R3.2 P2_R4.1
P2_U2N
  Bottom 0.7: P2_POT1.1 129.54,50.8 129.54,62.23 130.81,62.23 130.81,63.5 133.35,63.5 133.35,64.77 137.16,64.77 | P2_IC1.9 135.89,78.74 135.89,77.47 134.62,77.47 134.62,68.58 137.16,68.58 P2_R5.2
P2_U3N
  Top 0.6: P2_IC1.13 139.7,88.9 P2_C1.1
  Bottom 0.7: P2_POT2.2 P2_POT2.3 | P2_C1.1 139.7,101.6 147.32,101.6 P2_R11.1
P2_U4N
  Bottom 0.7: P2_IC2.2 97.79,63.5 97.79,64.77 93.98,64.77 93.98,68.58 97.79,68.58 97.79,69.85 99.06,69.85 99.06,72.39 97.79,72.39 97.79,81.28 P2_POT3.1 | 97.79,76.2 P2_C2.2
P2_U5P  (via drill 0.9 pad 2)
  Top 0.6: v101.6,68.58 105.41,68.58 105.41,69.85 109.22,69.85 P2_RBIAS.1
  Bottom 0.7: P2_IC2.5 101.6,55.88 v101.6,68.58
P2_VCAL
  Top 0.6: P2_POT4.2 116.84,73.66 116.84,66.04 119.38,66.04 P2_R16.1
P2_VD
  Top 0.6: P2_POT3.2 96.52,86.36 96.52,73.66 99.06,73.66 P2_IC2.1
  Bottom 0.7: P2_POT3.2 P2_R9.1
P2_VDIV
  Bottom 0.7: P2_POT4.1 115.57,68.58 115.57,59.69 116.84,59.69 P2_R17.2
P2_VE
  Top 0.6: P2_R6.1 129.54,68.58 P2_IC1.7 134.62,76.2 134.62,71.12 P2_R5.1 | P2_R2.2 130.81,93.98 130.81,92.71 132.08,92.71 132.08,76.2
  Bottom 0.7: P2_IC1.7 130.81,76.2 130.81,77.47 132.08,77.47 132.08,85.09 134.62,85.09 134.62,92.71 135.89,92.71 135.89,95.25 142.24,95.25 P2_POT2.1
P2_VI
  Bottom 0.7: P2_R8.1 140.97,81.28 140.97,87.63 139.7,87.63 139.7,91.44 | 140.97,82.55 147.32,82.55 P2_R11.2 | P2_IC1.14 143.51,91.44 143.51,92.71 144.78,92.71 P2_C1.2
P2_VINP
  Bottom 0.7: P2_IC2.12 107.95,60.96 107.95,62.23 111.76,62.23 P2_R16.2
P2_VOFF
  Bottom 0.7: P2_ROFFSET.1 P2_IC2.8 P2_IC2.9
P2_VOFFD
  Bottom 0.7: P2_IC2.10 102.87,55.88 102.87,67.31 104.14,67.31 P2_R15.1 100.33,71.12 100.33,74.93 101.6,74.93 101.6,77.47 102.87,77.47 102.87,81.28 P2_R14.2
P2_VP
  Bottom 0.7: P2_POT1.2 133.35,55.88 133.35,60.96 | P2_POT1.3 139.7,60.96 139.7,64.77 140.97,64.77 140.97,67.31 142.24,67.31 142.24,69.85 139.7,69.85 139.7,72.39 138.43,72.39 138.43,73.66 137.16,73.66 P2_IC1.8
P2_VPID
  Bottom 0.7: P2_IC2.7 99.06,45.72 142.24,45.72 142.24,59.69 143.51,59.69 143.51,62.23 149.86,62.23 P2_R10.2 160.02,63.5 P2_J_OUT.1 | 116.84,45.72 P2_R17.1
P2_VREF
  Bottom 0.7: P2_R1.1 121.92,81.28 121.92,88.9 125.73,88.9 125.73,87.63 128.27,87.63 128.27,88.9 P2_IC1.2 P2_IC1.1
P2_VREFD
  Bottom 0.7: P2_IC1.3 132.08,86.36 132.08,99.06 P2_R13.1
P2_VSEN
  Bottom 0.7: P2_J_IN.1 96.52,78.74 96.52,82.55 97.79,82.55 97.79,83.82 P2_R3.1

### Text on the board
tPlace: PID 1 | PID 2 | +16V | -16V | GND | +5V | +16V | -16V | GND | +5V | U3 | U6 | U3 | U6 | VSEN | VPID | VSEN | VPID | U1 | U2 | U1 | U2 | U4 | U8 | U4 | U8 | U5 | U7 | U5 | U7 | RS 3 x 1R/5W = 0.33R | RS 3 x 1R/5W = 0.33R | E | E | C | C | B | B | BOB+ | BOB- | BOB+ | BOB- | GND | GND | PGND | PGND | +VBOB | PGND | +VBOB | PGND